# EasyEDA Pro project main_control_board.eprj, board PCB1
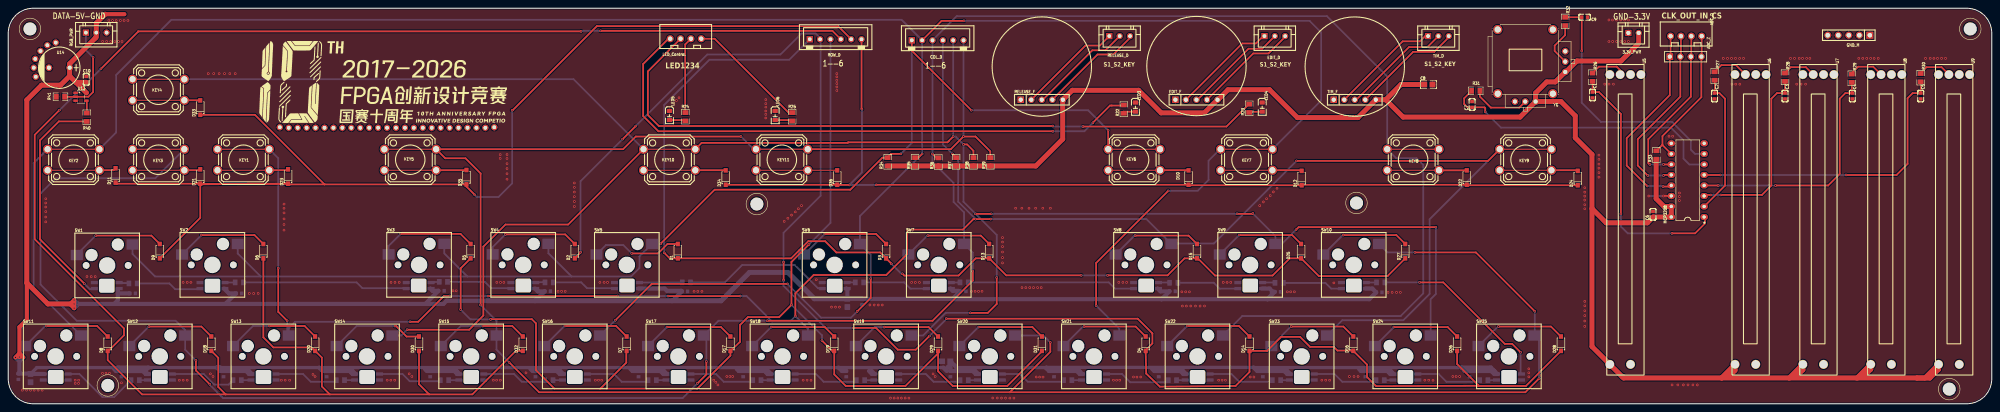
[diagram p1: board, top side]
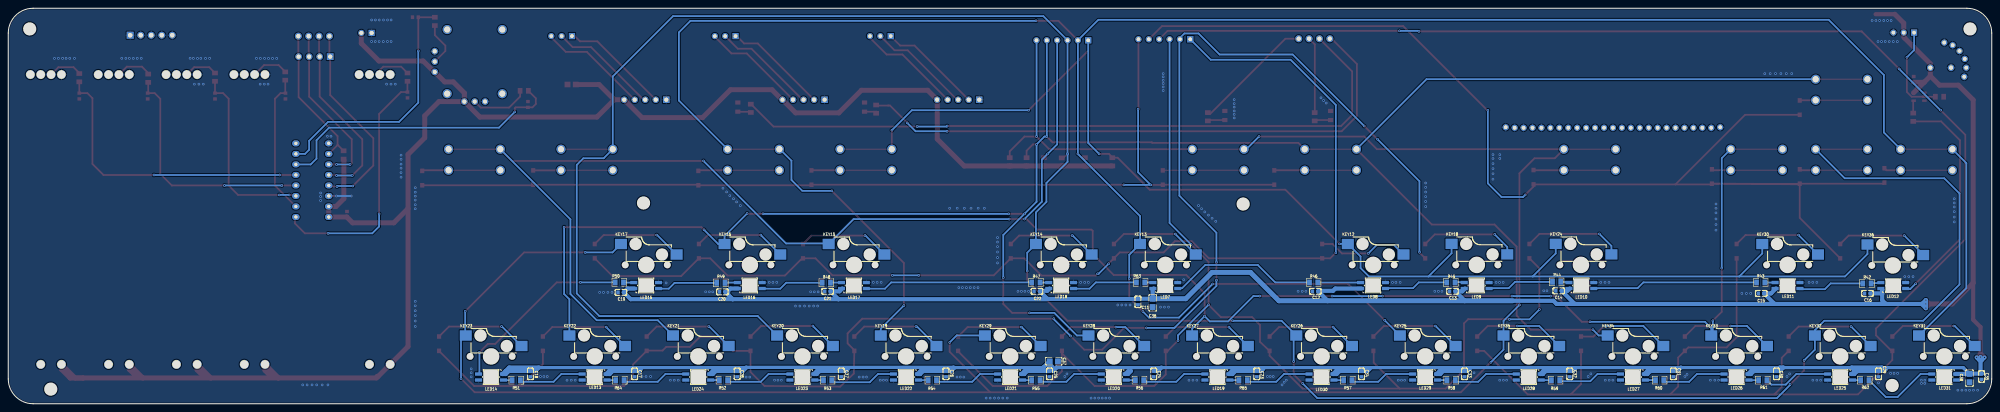
[diagram p2: board, bottom side, seen from below]

Outline 478.92 x 95.5 mm; copper layers: Top Layer, Bottom Layer. Coordinates in mm from the lower left corner of the outline.
Outline path: 0,89.5 0,6 arc(1.76,1.76) 6,0 472.92,0 arc(477.16,1.76) 478.92,6 478.92,89.5 arc(477.16,93.75) 472.92,95.5 6,95.5 arc(1.76,93.75) 0,89.5
Stack: Top Layer 0.035mm / Dielectric1 1.51mm FR4 er 4.5 / Bottom Layer 0.035mm

## Design rules (mm)
template: JLCPCB Capability(Two Layers Board)
spacing copperThickness1oz (default): track to track 0.102, other pairs 0.152 to 0.3
spacing copperThickness2oz: track to track 0.203, other pairs 0.152 to 0.3
track width copperThickness1oz (default): min 0.127, default 0.254, max 2.54
track width copperThickness2oz: min 0.203, default 0.254, max 2.54
differential pair differentialPair (default): width min 0.127, default 0.254, max 2.54; gap min 0.152, default 0.152
via viaSize (default): diameter min 0.5, default 0.61, max 10; hole min 0.3, default 0.305, max 6.3

## Placement (name value [footprint] x y rotation side)
3.3V_PWR  HX-XH2.54-2PZZ  [CONN-TH_2P-P2.50_HX-2.54MM-2P-ZZ-MS]  392.43 89.55 0 top
ADC_D  XH2.54_4P_直插  [CONN-TH_4P-P2.50-XH2.54-4P]  405.13 88.77 180 top
ADC_Z  HDR-M_2.54_1x4P  [HDR-TH_HDR-M_2.54_1X4P]  405 83.82 0 top
C1  100nF  [C0603]  382.52 74.56 270 top
C2  100nF  [C0603]  411.99 74.31 270 top
C3  100nF  [C0603]  429.01 74.31 270 top
C4  100nF  [C0603]  445.26 74.31 270 top
C5  100nF  [C0603]  461.77 74.31 270 top
C6  100nF  [C0603]  397.13 45.73 90 top
C7  100nF  [C0603]  353.44 72.28 90 top
C8  4.7uF  [C0805]  342.9 77.09 0 top
C9  100nF  [C0603]  380.62 93.35 180 top
C10  100nF  [C0603]  18.83 78.33 270 top
C11  100nF  [C0603]  206.15 24.61 90 bottom
C12  100nF  [C0603]  163.32 27.14 180 bottom
C13  100nF  [C0603]  130.21 27.15 0 bottom
C14  100nF  [C0603]  104.55 27.27 0 bottom
C15  100nF  [C0603]  55.66 26.64 0 bottom
C16  100nF  [C0603]  30 26.64 0 bottom
C17  100nF  [C0603]  327.69 7.21 90 bottom
C18  100nF  [C0603]  352.84 7.21 90 bottom
C19  100nF  [C0603]  330.99 26.89 0 bottom
C20  100nF  [C0603]  306.48 27.02 0 bottom
C21  100nF  [C0603]  281.08 27.15 0 bottom
C22  100nF  [C0603]  230.54 27.15 0 bottom
C23  100nF  [C0603]  177.45 7.21 90 bottom
C24  100nF  [C0603]  202.34 7.21 90 bottom
C25  100nF  [C0603]  227.49 7.21 270 bottom
C26  100nF  [C0603]  252.51 7.21 270 bottom
C27  100nF  [C0603]  277.78 7.21 270 bottom
C28  100nF  [C0603]  302.93 7.21 270 bottom
C29  100nF  [C0603]  27.34 7.21 90 bottom
C30  100nF  [C0603]  51.97 7.21 90 bottom
C31  100nF  [C0603]  76.87 7.21 270 bottom
C32  100nF  [C0603]  101.89 7.21 270 bottom
C33  100nF  [C0603]  127.29 7.21 270 bottom
C34  100nF  [C0603]  152.18 7.21 270 bottom
C35  100nF  [C0603]  2.44 6.57 90 bottom
C36  10uF  [C0805]  202.6 24.35 270 bottom
C37  10uF  [C0805]  226.47 10.26 180 bottom
C38  10uF  [C0805]  5.37 6.19 270 bottom
COL_D  HX-XH2.54-6PZZ  [CONN-TH_6P-P2.50_BX-XH2.54-6PZZ]  224.41 87.77 0 top
D1  1N4148W  [SOD-123F_L2.7-W1.6-LS3.8-RD]  161.67 36.84 90 top
D2  1N4148W  [SOD-123F_L2.7-W1.6-LS3.8-RD]  136.78 36.84 90 top
D3  1N4148W  [SOD-123F_L2.7-W1.6-LS3.8-RD]  211.96 36.84 90 top
D4  1N4148W  [SOD-123F_L2.7-W1.6-LS3.8-RD]  274.63 14.49 90 top
D5  1N4148W  [SOD-123F_L2.7-W1.6-LS3.8-RD]  111.63 36.84 90 top
D6  1N4148W  [SOD-123F_L2.7-W1.6-LS3.8-RD]  61.6 36.84 90 top
D7  1N4148W  [SOD-123F_L2.7-W1.6-LS3.8-RD]  149.3 14.49 90 top
D8  1N4148W  [SOD-123F_L2.7-W1.6-LS3.8-RD]  24 14.49 90 top
D9  1N4148W  [SOD-123F_L2.7-W1.6-LS3.8-RD]  36.58 36.84 90 top
D10  1N4148W  [SOD-123F_L2.7-W1.6-LS3.8-RD]  284.99 54.62 90 top
D11  1N4148W  [SOD-123F_L2.7-W1.6-LS3.8-RD]  25.91 55.13 90 top
D12  1N4148W  [SOD-123F_L2.7-W1.6-LS3.8-RD]  312.29 54.5 90 top
D13  1N4148W  [SOD-123F_L2.7-W1.6-LS3.8-RD]  236.86 36.84 90 top
D14  1N4148W  [SOD-123F_L2.7-W1.6-LS3.8-RD]  299.7 14.49 90 top
D15  1N4148W  [SOD-123F_L2.7-W1.6-LS3.8-RD]  287.02 36.84 90 top
D16  1N4148W  [SOD-123F_L2.7-W1.6-LS3.8-RD]  324.77 14.49 90 top
D17  1N4148W  [SOD-123F_L2.7-W1.6-LS3.8-RD]  174.37 14.49 90 top
D18  1N4148W  [SOD-123F_L2.7-W1.6-LS3.8-RD]  49.03 14.49 90 top
D19  1N4148W  [SOD-123F_L2.7-W1.6-LS3.8-RD]  199.43 14.49 90 top
D20  1N4148W  [SOD-123F_L2.7-W1.6-LS3.8-RD]  74.1 14.49 90 top
D21  1N4148W  [SOD-123F_L2.7-W1.6-LS3.8-RD]  46.36 54.88 90 top
D22  1N4148W  [SOD-123F_L2.7-W1.6-LS3.8-RD]  352.17 54.62 90 top
D23  1N4148W  [SOD-123F_L2.7-W1.6-LS3.8-RD]  67.56 54.88 90 top
D24  1N4148W  [SOD-123F_L2.7-W1.6-LS3.8-RD]  378.97 54.5 90 top
D25  1N4148W  [SOD-123F_L2.7-W1.6-LS3.8-RD]  312.17 36.84 90 top
D26  1N4148W  [SOD-123F_L2.7-W1.6-LS3.8-RD]  349.84 14.49 90 top
D27  1N4148W  [SOD-123F_L2.7-W1.6-LS3.8-RD]  337.31 36.84 90 top
D28  1N4148W  [SOD-123F_L2.7-W1.6-LS3.8-RD]  374.9 14.49 90 top
D29  1N4148W  [SOD-123F_L2.7-W1.6-LS3.8-RD]  224.5 14.49 90 top
D30  1N4148W  [SOD-123F_L2.7-W1.6-LS3.8-RD]  99.17 14.49 90 top
D31  1N4148W  [SOD-123F_L2.7-W1.6-LS3.8-RD]  249.57 14.49 90 top
D32  1N4148W  [SOD-123F_L2.7-W1.6-LS3.8-RD]  124.23 14.49 90 top
D33  1N4148W  [SOD-123F_L2.7-W1.6-LS3.8-RD]  46.36 71.51 90 top
D34  1N4148W  [SOD-123F_L2.7-W1.6-LS3.8-RD]  173.23 54.62 90 top
D35  1N4148W  [SOD-123F_L2.7-W1.6-LS3.8-RD]  110.63 54.71 90 top
D36  1N4148W  [SOD-123F_L2.7-W1.6-LS3.8-RD]  200.15 54.62 90 top
EDIT_D  HX 2.54mm-3P ZZ-MS  [CONN-TH_3P-P2.50_HX-2.54MM-3P-ZZ-MS]  305.82 88.79 0 top
EDIT_F  -  [HDR-TH_5P-P2.54-V-F]  286.89 73.42 0 top
GND_M  -  [HDR-TH_5P-P2.54-V-M]  444.4 89 180 top
KEY1  轻触开关12x12x9直插  [KEY-TH_4P-L12.0-W12.0-P5.00-LS12.5]  56.77 58.93 0 top
KEY2  轻触开关12x12x9直插  [KEY-TH_4P-L12.0-W12.0-P5.00-LS12.5]  15.75 58.93 0 top
KEY3  轻触开关12x12x9直插  [KEY-TH_4P-L12.0-W12.0-P5.00-LS12.5]  36.26 58.93 0 top
KEY4  轻触开关12x12x9直插  [KEY-TH_4P-L12.0-W12.0-P5.00-LS12.5]  36.26 75.83 0 top
KEY5  轻触开关12x12x9直插  [KEY-TH_4P-L12.0-W12.0-P5.00-LS12.5]  97.06 58.93 0 top
KEY6  轻触开关12x12x9直插  [KEY-TH_4P-L12.0-W12.0-P5.00-LS12.5]  271.84 58.93 0 top
KEY7  轻触开关12x12x9直插  [KEY-TH_4P-L12.0-W12.0-P5.00-LS12.5]  298.99 58.93 0 top
KEY8  轻触开关12x12x9直插  [KEY-TH_4P-L12.0-W12.0-P5.00-LS12.5]  339.21 58.93 0 top
KEY9  轻触开关12x12x9直插  [KEY-TH_4P-L12.0-W12.0-P5.00-LS12.5]  366.36 58.93 0 top
KEY10  轻触开关12x12x9直插  [KEY-TH_4P-L12.0-W12.0-P5.00-LS12.5]  159.64 58.93 0 top
KEY11  轻触开关12x12x9直插  [KEY-TH_4P-L12.0-W12.0-P5.00-LS12.5]  186.78 58.93 0 top
KEY12  CPG151101S11  [TH_L10.9-W5.9-CPG151101S11]  148.75 37.31 180 bottom
KEY13  CPG151101S11  [TH_L10.9-W5.9-CPG151101S11]  198.91 37.31 180 bottom
KEY14  CPG151101S11  [TH_L10.9-W5.9-CPG151101S11]  224.06 37.31 180 bottom
KEY15  CPG151101S11  [TH_L10.9-W5.9-CPG151101S11]  274.1 37.31 180 bottom
KEY16  CPG151101S11  [TH_L10.9-W5.9-CPG151101S11]  299.24 37.31 180 bottom
KEY17  CPG151101S11  [TH_L10.9-W5.9-CPG151101S11]  324.26 37.31 180 bottom
KEY18  CPG151101S11  [TH_L10.9-W5.9-CPG151101S11]  123.7 37.34 180 bottom
KEY19  CPG151101S11  [TH_L10.9-W5.9-CPG151101S11]  261.52 15.21 180 bottom
KEY20  CPG151101S11  [TH_L10.9-W5.9-CPG151101S11]  286.54 15.21 180 bottom
KEY21  CPG151101S11  [TH_L10.9-W5.9-CPG151101S11]  311.69 15.21 180 bottom
KEY22  CPG151101S11  [TH_L10.9-W5.9-CPG151101S11]  336.71 15.21 180 bottom
KEY23  CPG151101S11  [TH_L10.9-W5.9-CPG151101S11]  361.73 15.21 180 bottom
KEY24  CPG151101S11  [TH_L10.9-W5.9-CPG151101S11]  98.55 37.34 180 bottom
KEY25  CPG151101S11  [TH_L10.9-W5.9-CPG151101S11]  136.18 15.21 180 bottom
KEY26  CPG151101S11  [TH_L10.9-W5.9-CPG151101S11]  161.19 15.21 180 bottom
KEY27  CPG151101S11  [TH_L10.9-W5.9-CPG151101S11]  186.34 15.21 180 bottom
KEY28  CPG151101S11  [TH_L10.9-W5.9-CPG151101S11]  211.36 15.21 180 bottom
KEY29  CPG151101S11  [TH_L10.9-W5.9-CPG151101S11]  236.38 15.21 180 bottom
KEY30  CPG151101S11  [TH_L10.9-W5.9-CPG151101S11]  48.67 37.31 180 bottom
KEY31  CPG151101S11  [TH_L10.9-W5.9-CPG151101S11]  10.83 15.21 180 bottom
KEY32  CPG151101S11  [TH_L10.9-W5.9-CPG151101S11]  35.97 15.21 180 bottom
KEY33  CPG151101S11  [TH_L10.9-W5.9-CPG151101S11]  60.99 15.21 180 bottom
KEY34  CPG151101S11  [TH_L10.9-W5.9-CPG151101S11]  86.01 15.21 180 bottom
KEY35  CPG151101S11  [TH_L10.9-W5.9-CPG151101S11]  111.16 15.21 180 bottom
KEY36  CPG151101S11  [TH_L10.9-W5.9-CPG151101S11]  23.27 37.18 180 bottom
LED3  NCD0805R1  [LED0805-RD]  272.16 71.64 270 top
LED4  NCD0805R1  [LED0805-RD]  302.77 71.64 270 top
LED5  NCD0805R1  [LED0805-RD]  159.64 69.61 270 top
LED6  NCD0805R1  [LED0805-RD]  185.17 69.61 270 top
LED7  SK6812MINI-E  [LED-SMD_4P-L3.2-W2.8-LS5.9_SK6812MINI-E]  199.55 28.54 180 bottom
LED8  SK6812MINI-E  [LED-SMD_4P-L3.2-W2.8-LS5.9_SK6812MINI-E]  149.38 28.54 180 bottom
LED9  SK6812MINI-E  [LED-SMD_4P-L3.2-W2.8-LS5.9_SK6812MINI-E]  124.36 28.54 180 bottom
LED10  SK6812MINI-E  [LED-SMD_4P-L3.2-W2.8-LS5.9_SK6812MINI-E]  99.09 28.54 180 bottom
LED11  SK6812MINI-E  [LED-SMD_4P-L3.2-W2.8-LS5.9_SK6812MINI-E]  49.31 28.54 180 bottom
LED12  SK6812MINI-E  [LED-SMD_4P-L3.2-W2.8-LS5.9_SK6812MINI-E]  23.78 28.54 180 bottom
LED13  SK6812MINI-E  [LED-SMD_4P-L3.2-W2.8-LS5.9_SK6812MINI-E]  337.34 6.45 0 bottom
LED14  SK6812MINI-E  [LED-SMD_4P-L3.2-W2.8-LS5.9_SK6812MINI-E]  362.36 6.45 0 bottom
LED15  SK6812MINI-E  [LED-SMD_4P-L3.2-W2.8-LS5.9_SK6812MINI-E]  324.9 28.54 180 bottom
LED16  SK6812MINI-E  [LED-SMD_4P-L3.2-W2.8-LS5.9_SK6812MINI-E]  299.88 28.54 180 bottom
LED17  SK6812MINI-E  [LED-SMD_4P-L3.2-W2.8-LS5.9_SK6812MINI-E]  274.73 28.54 180 bottom
LED18  SK6812MINI-E  [LED-SMD_4P-L3.2-W2.8-LS5.9_SK6812MINI-E]  224.69 28.54 180 bottom
LED19  SK6812MINI-E  [LED-SMD_4P-L3.2-W2.8-LS5.9_SK6812MINI-E]  186.98 6.45 0 bottom
LED20  SK6812MINI-E  [LED-SMD_4P-L3.2-W2.8-LS5.9_SK6812MINI-E]  211.99 6.45 0 bottom
LED21  SK6812MINI-E  [LED-SMD_4P-L3.2-W2.8-LS5.9_SK6812MINI-E]  237.01 6.45 0 bottom
LED22  SK6812MINI-E  [LED-SMD_4P-L3.2-W2.8-LS5.9_SK6812MINI-E]  262.16 6.45 0 bottom
LED23  SK6812MINI-E  [LED-SMD_4P-L3.2-W2.8-LS5.9_SK6812MINI-E]  287.18 6.45 0 bottom
LED24  SK6812MINI-E  [LED-SMD_4P-L3.2-W2.8-LS5.9_SK6812MINI-E]  312.32 6.45 0 bottom
LED25  SK6812MINI-E  [LED-SMD_4P-L3.2-W2.8-LS5.9_SK6812MINI-E]  36.61 6.45 0 bottom
LED26  SK6812MINI-E  [LED-SMD_4P-L3.2-W2.8-LS5.9_SK6812MINI-E]  61.63 6.45 0 bottom
LED27  SK6812MINI-E  [LED-SMD_4P-L3.2-W2.8-LS5.9_SK6812MINI-E]  86.65 6.45 0 bottom
LED28  SK6812MINI-E  [LED-SMD_4P-L3.2-W2.8-LS5.9_SK6812MINI-E]  111.79 6.45 0 bottom
LED29  SK6812MINI-E  [LED-SMD_4P-L3.2-W2.8-LS5.9_SK6812MINI-E]  136.81 6.45 0 bottom
LED30  SK6812MINI-E  [LED-SMD_4P-L3.2-W2.8-LS5.9_SK6812MINI-E]  161.83 6.45 0 bottom
LED31  SK6812MINI-E  [LED-SMD_4P-L3.2-W2.8-LS5.9_SK6812MINI-E]  11.46 6.45 0 bottom
LED_Control  XH2.54_4P_直插  [CONN-TH_4P-P2.50-XH2.54-4P]  163.58 88.15 180 top
MCP3208  MCP3208-BI/P  [PDIP-16_L19.3-W6.4-P2.54-LS7.94-BL]  405.51 53.99 90 top
NOREF  -  [Pad_e3146]  97.93 66.64 0 top
NOREF#2  -  [Pad_e3066]  6.51 83.28 0 top
NOREF#3  -  [Pad_e3147]  95.77 66.64 0 top
NOREF#4  -  [Pad_e3154]  80.67 66.64 0 top
NOREF#5  -  [Pad_e3155]  78.51 66.64 0 top
NOREF#6  -  [Pad_e3148]  93.61 66.64 0 top
NOREF#7  -  [Pad_e3143]  104.4 66.64 0 top
NOREF#8  -  [Pad_e3151]  87.14 66.64 0 top
NOREF#9  -  [Pad_e3153]  82.83 66.64 0 top
NOREF#10  -  [Pad_e3072]  11.46 87.22 0 top
NOREF#11  -  [Pad_e3160]  67.72 66.64 0 top
NOREF#12  -  [Pad_e3159]  69.88 66.64 0 top
NOREF#13  -  [Pad_e3138]  115.19 66.64 0 top
NOREF#14  -  [Pad_e3140]  110.88 66.64 0 top
NOREF#15  -  [Pad_e3150]  89.3 66.64 0 top
NOREF#16  -  [Pad_e3142]  106.56 66.64 0 top
NOREF#17  -  [Pad_e3071]  9.43 86.58 0 top
NOREF#18  -  [Pad_e3145]  100.09 66.64 0 top
NOREF#19  -  [Pad_e3152]  84.98 66.64 0 top
NOREF#20  -  [Pad_e3144]  102.25 66.64 0 top
NOREF#21  -  [Pad_e3158]  72.04 66.64 0 top
NOREF#22  -  [Pad_e3067]  7.78 85.19 0 top
NOREF#23  -  [Pad_e3068]  6.64 78.96 0 top
NOREF#24  -  [Pad_e3139]  113.04 66.64 0 top
NOREF#25  -  [Pad_e3149]  91.46 66.64 0 top
NOREF#26  -  [Pad_e3161]  65.56 66.77 0 top
NOREF#27  -  [Pad_e3137]  117.35 66.77 0 top
NOREF#28  -  [Pad_e3141]  108.72 66.64 0 top
NOREF#29  -  [Pad_e3156]  76.35 66.64 0 top
NOREF#30  -  [Pad_e3157]  74.19 66.64 0 top
NOREF#31  -  [Pad_e3065]  6.16 81.15 0 top
R22  1kΩ  [R0805]  269.38 71.15 90 top
R23  1kΩ  [R0805]  299.62 71.34 90 top
R24  1kΩ  [R0805]  163.48 69.31 90 top
R25  1kΩ  [R0805]  189.26 69.31 90 top
R26  1kΩ  [R0805]  382.52 78.87 270 top
R27  1kΩ  [R0805]  412.05 79.15 270 top
R28  1kΩ  [R0805]  429.01 78.87 270 top
R29  1kΩ  [R0805]  445.14 78.61 270 top
R30  1kΩ  [R0805]  461.77 78.74 270 top
R31  1kΩ  [R0805]  354.33 75.57 180 top
R32  1kΩ  [R0805]  375.92 92.33 270 top
R33  10kΩ  [R0805]  397.94 60.08 90 top
R34  1kΩ  [R0805]  212.34 58.42 90 top
R35  1kΩ  [R0805]  218.95 58.42 90 top
R36  1kΩ  [R0805]  224.57 58.36 90 top
R37  1kΩ  [R0805]  228.85 58.42 90 top
R38  1kΩ  [R0805]  233.05 58.42 90 top
R39  1kΩ  [R0805]  237.11 58.42 90 top
R40  330Ω  [R0805]  18.95 69.18 270 top
R41  10kΩ  [R0805]  12.6 74.14 0 top
R42  330Ω  [R0805]  30.13 29.05 180 bottom
R43  330Ω  [R0805]  55.78 29.31 180 bottom
R44  330Ω  [R0805]  105.06 29.43 180 bottom
R45  330Ω  [R0805]  130.59 29.31 180 bottom
R46  330Ω  [R0805]  163.73 29.31 180 bottom
R47  330Ω  [R0805]  230.79 29.31 180 bottom
R48  330Ω  [R0805]  281.4 29.22 180 bottom
R49  330Ω  [R0805]  306.86 29.18 180 bottom
R50  330Ω  [R0805]  331.37 29.31 180 bottom
R51  330Ω  [R0805]  356.27 5.68 0 bottom
R52  330Ω  [R0805]  306.23 5.68 0 bottom
R53  330Ω  [R0805]  281.08 5.68 0 bottom
R54  330Ω  [R0805]  255.81 5.68 0 bottom
R55  330Ω  [R0805]  230.79 5.68 0 bottom
R56  330Ω  [R0805]  205.77 5.68 0 bottom
R57  330Ω  [R0805]  155.48 5.68 0 bottom
R58  330Ω  [R0805]  130.53 5.69 0 bottom
R59  330Ω  [R0805]  105.31 5.68 0 bottom
R60  330Ω  [R0805]  80.18 5.69 0 bottom
R61  330Ω  [R0805]  55.28 5.68 0 bottom
R62  330Ω  [R0805]  30.64 5.68 0 bottom
R63  330Ω  [R0805]  205.52 29.31 180 bottom
R64  330Ω  [R0805]  331.25 5.68 0 bottom
R65  330Ω  [R0805]  180.75 5.68 0 bottom
RELEASE_D  HX 2.54mm-3P ZZ-MS  [CONN-TH_3P-P2.50_HX-2.54MM-3P-ZZ-MS]  268.35 88.79 0 top
RELEASE_F  -  [HDR-TH_5P-P2.54-V-F]  249.56 73.42 0 top
RGB_PWR  HX 2.54mm-3P ZZ-MS  [CONN-TH_3P-P2.50_HX-2.54MM-3P-ZZ-MS]  21.24 89.63 0 top
ROW_D  HX-XH2.54-6PZZ  [CONN-TH_6P-P2.50_BX-XH2.54-6PZZ]  199.77 88.02 0 top
SW1  MX1A-11NW  [SW-TH_MX1A-11NW]  23.24 37.21 0 top
SW2  MX1A-11NW  [SW-TH_MX1A-11NW]  48.64 37.34 0 top
SW3  MX1A-11NW  [SW-TH_MX1A-11NW]  98.55 37.34 0 top
SW4  MX1A-11NW  [SW-TH_MX1A-11NW]  123.7 37.34 0 top
SW5  MX1A-11NW  [SW-TH_MX1A-11NW]  148.72 37.34 0 top
SW6  MX1A-11NW  [SW-TH_MX1A-11NW]  198.88 37.34 0 top
SW7  MX1A-11NW  [SW-TH_MX1A-11NW]  224.03 37.34 0 top
SW8  MX1A-11NW  [SW-TH_MX1A-11NW]  274.07 37.34 0 top
SW9  MX1A-11NW  [SW-TH_MX1A-11NW]  299.21 37.34 0 top
SW10  MX1A-11NW  [SW-TH_MX1A-11NW]  324.23 37.34 0 top
SW11  MX1A-11NW  [SW-TH_MX1A-11NW]  10.8 15.24 0 top
SW12  MX1A-11NW  [SW-TH_MX1A-11NW]  35.94 15.24 0 top
SW13  MX1A-11NW  [SW-TH_MX1A-11NW]  60.96 15.24 0 top
SW14  MX1A-11NW  [SW-TH_MX1A-11NW]  85.98 15.24 0 top
SW15  MX1A-11NW  [SW-TH_MX1A-11NW]  111.12 15.24 0 top
SW16  MX1A-11NW  [SW-TH_MX1A-11NW]  136.14 15.24 0 top
SW17  MX1A-11NW  [SW-TH_MX1A-11NW]  161.16 15.24 0 top
SW18  MX1A-11NW  [SW-TH_MX1A-11NW]  186.31 15.24 0 top
SW19  MX1A-11NW  [SW-TH_MX1A-11NW]  211.33 15.24 0 top
SW20  MX1A-11NW  [SW-TH_MX1A-11NW]  236.35 15.24 0 top
SW21  MX1A-11NW  [SW-TH_MX1A-11NW]  261.49 15.24 0 top
SW22  MX1A-11NW  [SW-TH_MX1A-11NW]  286.51 15.24 0 top
SW23  MX1A-11NW  [SW-TH_MX1A-11NW]  311.66 15.24 0 top
SW24  MX1A-11NW  [SW-TH_MX1A-11NW]  336.68 15.24 0 top
SW25  MX1A-11NW  [SW-TH_MX1A-11NW]  361.7 15.24 0 top
TIM_D  HX 2.54mm-3P ZZ-MS  [CONN-TH_3P-P2.50_HX-2.54MM-3P-ZZ-MS]  345.31 88.79 0 top
TIM_F  -  [HDR-TH_5P-P2.54-V-F]  325.12 73.42 0 top
U1  M3x10+6Cu  [SMD_L4.7-W4.7-D3.0]  5.24 90.52 0 top
U2  M3x10+6Cu  [SMD_L4.7-W4.7-D3.0]  473.74 90.52 0 top
U3  M3x10+6Cu  [SMD_L4.7-W4.7-D3.0]  24.03 4.41 0 top
U4  M3x10+6Cu  [SMD_L4.7-W4.7-D3.0]  468.66 3.52 0 top
U5  -  [Potentiometer]  394.21 79.5 270 top
U6  -  [Potentiometer]  424.43 79.5 270 top
U7  -  [Potentiometer]  440.82 79.5 270 top
U8  -  [Potentiometer]  457.2 79.5 270 top
U9  -  [Potentiometer]  473.58 79.5 270 top
U10  M3x10+6Cu  [SMD_L4.7-W4.7-D3.0]  180.75 48.23 0 top
U11  M3x10+6Cu  [SMD_L4.7-W4.7-D3.0]  325.53 48.48 0 top
U13  SN74AHCT1G125DBVR  [SOT-23-5_L3.0-W1.7-P0.95-LS2.8-BR]  17.56 74.14 180 top
U14  220uF  [CAP-TH_BD10.0-P5.00-D0.6-FD]  12.32 81.15 180 top
YG  YF16-FL7.2-B5Ka(45-10)-R-A28  [JOYTICK-TH_YF16-DFL7.2-B5KO-45-10-B5KO-55--RG-A22]  367.79 81.67 0 top

## Footprints (pads in the part's own frame, mm; a bottom-side part is the same pattern mirrored in y, then rotated)
C0603
  rect 0.8x0.9 smd: 1(-0.7,0) 2(0.7,0)
C0805
  rect 1.41x1.35 smd: 1(-1,0) 2(1,0)
CAP-TH_BD10.0-P5.00-D0.6-FD
  round 1.6 hole 1: 1(-2.5,0) 2(2.5,0)
CONN-TH_2P-P2.50_HX-2.54MM-2P-ZZ-MS
  rect 1.5x1.5 hole 1: 1(-1.25,0)
  round 1.5 hole 1: 2(1.25,0)
CONN-TH_3P-P2.50_HX-2.54MM-3P-ZZ-MS
  rect 1.5x1.5 hole 0.9: 1(-2.5,0)
  round 1.5 hole 0.9: 2(0,0) 3(2.5,0)
CONN-TH_4P-P2.50-XH2.54-4P
  round 1.7 hole 1.05: 1(3.75,0) 2(1.25,0) 3(-1.25,0) 4(-3.75,0)
CONN-TH_6P-P2.50_BX-XH2.54-6PZZ
  rect 1.524x1.524 hole 0.914: 1(-6.25,0)
  round 1.524 hole 0.914: 2(-3.75,0) 3(-1.25,0) 4(1.25,0) 5(3.75,0) 6(6.25,0)
HDR-TH_5P-P2.54-V-F
  rect 1.575x1.575 hole 1.02: 1(-5.08,0)
  round 1.575 hole 1.02: 2(-2.54,0) 3(0,0) 4(2.54,0) 5(5.08,0)
HDR-TH_5P-P2.54-V-M
  rect 1.7x1.7 hole 1.1: 1(-5.08,0)
  round 1.7 hole 1.1: 2(-2.54,0) 3(0,0) 4(2.54,0) 5(5.08,0)
HDR-TH_HDR-M_2.54_1X4P
  rect 1.62x1.62 hole 1.02: 1(-3.81,0)
  round 1.62 hole 1.02: 2(-1.27,0) 3(1.27,0) 4(3.81,0)
JOYTICK-TH_YF16-DFL7.2-B5KO-45-10-B5KO-55--RG-A22
  round 1.6 hole 1: 1(-4,-8.7) 2(-1.5,-8.7) 3(1,-8.7) 4(8.15,3.45) 5(8.15,0.95) 6(8.15,-1.55)
  round 2.2 hole 1.5: 7(-8.15,8.7) 8(5.15,8.7) 9(5.15,-6.8) 10(-8.15,-6.8)
KEY-TH_4P-L12.0-W12.0-P5.00-LS12.5
  round 2.2 hole 1.5: 1(-6.251,2.54) 2(6.251,2.54) 3(-6.251,-2.54) 4(6.251,-2.54)
LED0805-RD
  rect 1x1.25 smd: 1(-1.1,0) 2(1.1,0)
LED-SMD_4P-L3.2-W2.8-LS5.9_SK6812MINI-E
  rect 1.7x0.8 smd: 1(-3,-0.725) 2(-3,0.725) 3(3,0.725) 4(3,-0.725)
Pad_e3065
  round 1.524 hole 0.914: 1(0,0)
Pad_e3066
  round 1.524 hole 0.914: 2(0,0)
Pad_e3067
  round 1.524 hole 0.914: 3(0,0)
Pad_e3068
  round 1.524 hole 0.914: 4(0,0)
Pad_e3071
  round 1.524 hole 0.914: 1(0,0)
Pad_e3072
  round 1.524 hole 0.914: 2(0,0)
Pad_e3137
  round 1.524 hole 0.914: 3(0,0)
Pad_e3138
  round 1.524 hole 0.914: 4(0,0)
Pad_e3139
  round 1.524 hole 0.914: 5(0,0)
Pad_e3140
  round 1.524 hole 0.914: 6(0,0)
Pad_e3141
  round 1.524 hole 0.914: 7(0,0)
Pad_e3142
  round 1.524 hole 0.914: 8(0,0)
Pad_e3143
  round 1.524 hole 0.914: 9(0,0)
Pad_e3144
  round 1.524 hole 0.914: 10(0,0)
Pad_e3145
  round 1.524 hole 0.914: 11(0,0)
Pad_e3146
  round 1.524 hole 0.914: 12(0,0)
Pad_e3147
  round 1.524 hole 0.914: 13(0,0)
Pad_e3148
  round 1.524 hole 0.914: 14(0,0)
Pad_e3149
  round 1.524 hole 0.914: 15(0,0)
Pad_e3150
  round 1.524 hole 0.914: 16(0,0)
Pad_e3151
  round 1.524 hole 0.914: 17(0,0)
Pad_e3152
  round 1.524 hole 0.914: 18(0,0)
Pad_e3153
  round 1.524 hole 0.914: 19(0,0)
Pad_e3154
  round 1.524 hole 0.914: 20(0,0)
Pad_e3155
  round 1.524 hole 0.914: 21(0,0)
Pad_e3156
  round 1.524 hole 0.914: 22(0,0)
Pad_e3157
  round 1.524 hole 0.914: 23(0,0)
Pad_e3158
  round 1.524 hole 0.914: 24(0,0)
Pad_e3159
  round 1.524 hole 0.914: 25(0,0)
Pad_e3160
  round 1.524 hole 0.914: 26(0,0)
Pad_e3161
  round 1.524 hole 0.914: 27(0,0)
PDIP-16_L19.3-W6.4-P2.54-LS7.94-BL
  oval 1.44x1.8 hole 0.8: 1(-8.89,-3.97) 2(-6.35,-3.97) 3(-3.81,-3.97) 4(-1.27,-3.97) 5(1.27,-3.97) 6(3.81,-3.97) 7(6.35,-3.97) 8(8.89,-3.97) 9(8.89,3.97) 10(6.35,3.97) 11(3.81,3.97) 12(1.27,3.97) 13(-1.27,3.97) 14(-3.81,3.97) 15(-6.35,3.97) 16(-8.89,3.97)
Potentiometer
  round 2.2 hole 2x1.2: 1(70,-7.5) 2(70,-2.5) 3(0,-7.5) 4(0,-5) 5(0,-2.5) 6(0,0)
R0805
  rect 1.133x1.377 smd: 1(-1,0) 2(1,0)
SOD-123F_L2.7-W1.6-LS3.8-RD
  rect 1.1x1 smd: 1(-1.735,0) 2(1.735,0)
SOT-23-5_L3.0-W1.7-P0.95-LS2.8-BR
  rect 1.1x0.6 smd: 1(1.3,-0.95) 2(1.3,0) 3(1.3,0.95) 4(-1.3,0.95) 5(-1.3,-0.95)
TH_L10.9-W5.9-CPG151101S11
  rect 2.9x2.5 smd: 1(-6.725,1.27) 2(6.725,-1.27)

## Nets
As in the schematic, except:
GND: 3.3V_PWR.1 C1.2 C2.2 C3.2 C4.2 C5.2 C6.2 C7.2 C8.2 C9.1 C10.1 C11.1 C12.1 C13.2 C14.2 C15.2 C16.2 C17.1 C18.1 C19.2 C20.2 C21.2 C22.2 C23.1 C24.1 C25.2 C26.2 C27.2 C28.2 C29.1 C30.1 C31.2 C32.2 C33.2 C34.2 C35.1 C36.2 C37.2 C38.2 EDIT_F.1 GND_M.1 GND_M.2 GND_M.3 GND_M.4 GND_M.5 LED3.1 LED4.1 LED5.1 LED6.1 LED7.3 LED8.3 LED9.3 LED10.3 LED11.3 LED12.3 LED13.3 LED14.3 LED15.3 LED16.3 LED17.3 LED18.3 LED19.3 LED20.3 LED21.3 LED22.3 LED23.3 LED24.3 LED25.3 LED26.3 LED27.3 LED28.3 LED29.3 LED30.3 LED31.3 MCP3208.9 MCP3208.14 NOREF.12 NOREF#2.2 NOREF#3.13 NOREF#4.20 NOREF#5.21 NOREF#6.14 NOREF#7.9 NOREF#8.17 NOREF#9.19 NOREF#10.2 NOREF#11.26 NOREF#12.25 NOREF#13.4 NOREF#14.6 NOREF#15.16 NOREF#16.8 NOREF#17.1 NOREF#18.11 NOREF#19.18 NOREF#20.10 NOREF#21.24 NOREF#22.3 NOREF#23.4 NOREF#24.5 NOREF#25.15 NOREF#26.27 NOREF#27.3 NOREF#28.7 NOREF#29.22 NOREF#30.23 NOREF#31.1 R41.1 RELEASE_F.1 RGB_PWR.3 TIM_F.1 U5.3 U6.3 U7.3 U8.3 U9.3 U13.1 U13.3 U14.2 YG.1 YG.4

Pads without a net: LED31 2; MCP3208 8; U5 2 5 6; U6 2 5 6; U7 2 5 6; U8 2 5 6; U9 2 5 6; YG 7 8 9 10

## Via types
v1: diameter 0.61, hole 0.305, Top Layer to Bottom Layer, 450 vias

## Routing (per net, layer and track width the routed paths; a pad name or vN(x,y) marks a point on that pad's centre or on a via; arc(x,y) is an arc through that point)
3.3V: length 453.5
  Top Layer w1.2: 431.58,6.45 433.32,8.19 U7.1 430.04,6.22 ; 382.4,47.12 385.83,43.69 395.78,43.69 397.19,45.1 MCP3208.16 MCP3208.15 399.78,47.64 397.89,49.53 397.89,58.82 ; 382.4,47.12 382.4,13.81 U5.1 389.61,6.6 389.89,6.6 ; 382.4,47.12 382.4,60.2 378.36,64.23 378.36,69.53 374.92,72.97 YG.3 ; R34.1 R35.1 224.5,57.42 R36.1 224.63,57.42 R37.1 R38.1 R39.1 248.11,57.42 254.6,63.91 254.6,73.39 RELEASE_F.5 256.92,75.71 272.92,75.71 278.38,70.24 288.8,70.24 EDIT_F.5 292.1,73.42 294.51,75.83 304.55,75.83 311.28,69.1 325.88,69.1 TIM_F.5 332.6,73.42 ; 3.3V_PWR.2 393.68,87.04 389.41,82.77 378.75,82.77 376.1,80.12 YG.6 373.54,77.72 371.48,77.72 368.79,75.04 YG.3 ; 415.32,6.45 416.93,8.06 U6.1 413.71,6.28 413.71,6.22 ; 447.96,6.57 449.7,8.31 U8.1 446.42,6.22 ; 332.6,73.42 336.27,77.09 C8.1 ; 332.6,73.42 336.79,69.23 365.05,69.23 YG.3 ; 430.04,6.22 446.42,6.22 ; 430.04,6.22 413.71,6.22 ; 446.42,6.22 460.87,6.22 ; 413.71,6.22 390.02,6.22 389.89,6.35 ; 460.87,6.22 462.8,6.22 U9.1 466.08,8.31 463.96,6.19 460.9,6.19 460.87,6.22
5V: length 1038.4
  Top Layer w1: v1(1.74,11.18) 2.57,12.01 2.7,12.01 ; 2.7,12.01 2.7,18.51 4.48,20.29 4.48,29.18 ; 2.7,12.01 2.8,12.01 v1(3.63,11.18) ; 2.7,12.01 v1(2.7,11.27) ; 15.91,23.72 v1(15.91,23.08) 14.89,24.1 ; 21.24,88.53 21.11,88.4 ; 23.4,94.08 28.03,94.08 ; 14.99,24.1 v1(15.91,24.1) v1(15.91,25.02) 14.99,24.1
  Top Layer w1.2: 16.32,77.63 U13.5 ; 16.32,77.63 14.82,79.13 ; 16.32,77.63 C10.2 ; 21.11,88.4 14.82,82.11 U14.1 14.82,79.15 12.6,76.93 8.03,76.93 4.48,73.37 4.48,29.18 9.56,24.1 14.89,24.1 ; 23.4,94.08 21.24,91.92 RGB_PWR.2 21.24,88.53
  Bottom Layer w0.8: C38.1 6.91,8.73 26.51,8.73 ; 300.69,8.78 250.7,8.78 250.65,8.73 229,8.73 ; 33.81,8.73 50.34,8.73 ; 225.78,8.73 51.15,8.73 ; 300.73,8.73 350.82,8.73
  Bottom Layer w1: 227.49,10.24 C37.1 227.47,9.53 226.68,8.73 ; 227.49,10.24 227.49,7.91 232.87,7.91 ; 227.49,10.24 229.01,8.72 229.01,8.1 ; 32.83,7.91 32.99,7.91 33.81,8.73 26.51,8.73 27.34,7.91 ; 32.83,7.91 32.81,7.88 32.49,7.88 ; 32.83,7.91 32.75,7.97 32.41,7.97 ; 32.83,7.91 33.81,7.17 33.2,7.17 32.49,7.88 ; 82.4,7.91 75.89,7.91 75.06,8.73 ; 82.4,7.91 83.11,7.91 83.85,7.17 83.14,7.17 82.4,7.91 ; 52.11,27.82 53.29,26.64 C15.1 52.42,24.1 ; 32.49,7.88 27.36,7.88 27.34,7.91 ; 32.49,7.88 32.41,7.97 ; 300.73,8.73 301.56,7.91 308.79,7.91 309.52,7.17 308.81,7.17 308.26,7.72 ; 229.39,27.27 228.04,27.27 227.49,27.82 ; 51.97,7.91 51.16,7.91 50.34,8.73 51.15,8.73 51.97,7.91 ; 51.97,7.91 57.43,7.91 ; 175.93,8.35 176.37,7.91 183.44,7.91 184.18,7.17 183.33,7.17 182.91,7.59 ; C22.1 228,25.31 C11.2 206.11,25.35 C36.1 202.6,27.57 202.35,27.82 ; v1(15.91,24.1) v1(15.91,25.02) 16.83,24.1 ; v1(15.91,24.1) 16.83,24.1 ; v1(15.91,24.1) v1(15.91,23.08) 16.83,24 16.83,24.1 ; 157.45,7.91 150.72,7.91 150.15,8.48 ; 157.45,7.91 157.13,8.22 ; 157.45,7.91 158.18,7.17 159.03,7.17 158.29,7.91 157.45,7.91 ; 127.16,27.82 127.84,27.15 C13.1 127.22,24.86 ; 2.7,10.47 2.7,7.53 C35.2 5.28,7.27 C38.1 8.64,7.19 8.66,7.17 ; 2.7,10.47 v1(2.7,11.27) ; 2.7,10.47 2.92,10.47 v1(3.63,11.18) ; 2.7,10.47 2.45,10.47 v1(1.74,11.18) ; 107.68,7.91 108.25,7.91 108.99,7.17 108.41,7.17 107.68,7.91 ; 107.68,7.91 101.06,7.91 100.62,8.35 ; 358.83,7.91 359.56,7.17 358.79,7.17 358.06,7.91 ; 358.83,7.91 358.06,7.91 ; 358.83,7.91 358,8.73 350.82,8.73 351.64,7.91 358.06,7.91 ; 327.7,27.82 329.37,27.82 C19.1 328.64,25.24 304,25.24 ; 232.87,7.91 233.6,7.17 234.21,7.17 233.48,7.91 232.87,7.91 ; 305.34,27.02 304.54,27.82 302.68,27.82 ; 305.34,27.02 C20.1 304,25.24 ; 305.34,27.02 305.09,26.77 ; 250.65,8.73 250.65,8.56 251.3,7.91 258.01,7.91 ; 200.48,8.73 201.3,7.91 202.34,7.91 ; 27.34,7.91 32.41,7.97 ; 27.34,7.91 26,7.91 25.56,8.35 ; 326.17,8.35 326.61,7.91 333.81,7.91 334.54,7.17 333.7,7.17 333.28,7.59 ; 101.89,27.82 102.44,27.27 C14.1 100.68,24.1 ; 304,25.24 278.48,25.24 ; 278.48,25.24 C21.1 278.2,27.15 277.53,27.82 ; 278.48,25.24 228.25,25.24 ; 16.83,24.1 25.56,24.1 ; 26.45,26.55 26.45,24.99 25.56,24.1 ; 26.45,26.55 26.45,27.56 26.58,27.69 ; 26.45,26.55 26.54,26.64 C16.1 ; 283.01,7.91 283.75,7.17 284.38,7.17 283.64,7.91 283.01,7.91 ; 283.01,7.91 276.7,7.91 276.13,8.48 ; 126.02,8.48 126.59,7.91 133.27,7.91 134.01,7.17 133.16,7.17 132.75,7.59 ; 152.18,27.82 158.49,27.82 159.04,27.27 162.49,27.27 C12.2 160.34,24.86 ; 258.01,7.91 258.62,7.91 259.36,7.17 258.75,7.17 258.01,7.91 ; 100.68,24.1 52.42,24.1 ; 100.68,24.1 105.06,24.1 105.82,24.86 115.69,24.86 ; 57.43,7.91 58.17,7.17 58.83,7.17 58.09,7.91 57.43,7.91 ; 208.46,7.91 209.19,7.17 ; 52.42,24.1 25.56,24.1 ; 208.56,7.17 207.82,7.91 ; 225.78,8.73 226.6,7.91
  Bottom Layer w1.2: 115.69,24.86 172.12,24.86 178.97,31.72 188.25,31.72 194.61,25.35 C36.1
GND: length 5.4
  Top Layer w0.42: v1(399.67,50.17) 399.68,50.18 MCP3208.14
  Bottom Layer w0.42: v1(399.67,50.17) v1(396.11,50.17)
  vias: v1(3.4,3.27) v1(4.4,3.27) v1(5.37,3.26) v1(6.25,3.27) v1(7.2,3.27) v1(8.17,3.27) v1(9.05,49.5) v1(9.05,48.49) v1(9.05,47.52) v1(9.05,46.4) v1(9.05,45.08) v1(9.05,43.91) v1(16.16,5.68) v1(16.16,4.92) v1(16.99,5.68) v1(16.96,4.92) v1(19,30.7) v1(20.02,30.7) v1(20.99,30.7) v1(22.79,87.47) v1(22.73,7.33) v1(23.58,7.33) v1(23.77,87.47) v1(24.29,92.55) v1(24.42,7.33) v1(24.74,87.47) v1(25.17,92.55) v1(25.71,87.47) v1(26.06,92.55) v1(26.61,87.47) v1(27.06,92.55) v1(27.34,5.05) v1(27.46,87.47) v1(27.96,92.55) v1(28.89,92.55) v1(41.31,5.68) v1(42.22,29.31) v1(42.24,5.68) v1(43.21,29.31) v1(43.19,5.68) v1(44.1,29.31) v1(48.29,79.72) v1(48.81,7.21) v1(49.43,6.57) v1(49.59,79.72) v1(50.9,79.72) v1(52.22,79.72) v1(53.49,79.72) v1(54.8,79.72) v1(58.2,26.64) v1(59.24,26.64) v1(60.34,26.64) v1(65.94,5.68) v1(66.58,48.23) v1(66.58,47.21) v1(66.58,46.08) v1(66.58,44.62) v1(66.58,43.27) v1(66.58,41.92) v1(66.85,5.68) v1(67.93,5.68) v1(73.56,7.08) v1(74.07,6.57) v1(91.47,5.68) v1(92.42,29.31) v1(92.36,5.68) v1(93.31,5.68) v1(93.37,29.31) v1(94.39,29.31) v1(96.81,7.21) v1(97.44,6.57) v1(107.4,27.27) v1(108.17,27.27) v1(117.13,5.68) v1(117.91,5.68) v1(117.97,29.31) v1(118.78,60.17) v1(118.78,59.24) v1(118.8,5.68) v1(118.87,29.31) v1(119.67,29.31) v1(120.43,60.17) v1(120.43,59.22) v1(120.43,57.98) v1(120.43,56.78) v1(120.43,55.55) v1(120.43,54.24) v1(125,7.46) v1(132.75,27.15) v1(133.6,27.15) v1(134.47,27.15) v1(136.68,53.31) v1(136.68,52.25) v1(136.68,51.13) v1(136.68,50.01) v1(136.68,48.84) v1(136.68,47.61) v1(141.76,5.68) v1(142.51,5.68) v1(142.84,29.31) v1(143.29,5.68) v1(143.86,29.31) v1(144.68,29.31) v1(160.69,72.61) v1(161.32,73.25) v1(161.96,73.88) v1(165.59,27.14) v1(166.49,27.14) v1(167.49,27.14) v1(170.34,5.68) v1(170.85,5.18) v1(171.35,4.54) v1(173.49,6.57) v1(174.22,6.57) v1(174.91,6.57) v1(182.91,73.44) v1(182.91,72.49) v1(182.91,71.64) v1(182.91,70.71) v1(182.91,69.88) v1(182.91,69.02) v1(187.36,44.04) v1(188.25,44.8) v1(189.13,45.56) v1(190.02,46.32) v1(190.79,47.09) v1(191.55,47.85) v1(191.93,5.68) v1(192.88,5.68) v1(193.83,5.68) v1(195.1,29.94) v1(198.78,23.34) v1(199.75,23.34) v1(200.06,79.72) v1(200.06,78.94) v1(200.06,78.08) v1(200.06,77.33) v1(200.06,76.51) v1(200.06,75.65) v1(200.69,23.34) v1(208.06,23.84) v1(209.07,23.84) v1(210.04,23.84) v1(211.02,23.84) v1(213.01,1.37) v1(213.9,1.37) v1(214.79,1.37) v1(215.64,1.37) v1(216.56,1.37) v1(217.47,1.37) v1(218.12,29.31) v1(219.02,29.31) v1(220,29.31) v1(223.3,7.21) v1(223.81,6.57) v1(232.57,27.15) v1(233.45,27.15) v1(234.27,27.15) v1(235.12,27.15) v1(237.72,1.37) v1(238.79,1.37) v1(239.81,1.37) v1(240.06,40.1) v1(240.06,39.05) v1(240.06,37.92) v1(240.06,36.65) v1(240.06,35.3) v1(240.06,34) v1(240.79,1.37) v1(241.84,1.37) v1(242.81,1.37) v1(243.24,47.21) v1(244.73,47.21) v1(244.76,28.04) v1(245.7,28.04) v1(246.46,47.21) v1(246.63,28.04) v1(247.57,28.04) v1(248.07,47.21) v1(248.19,6.45) v1(248.54,28.04) v1(249.02,6.45) v1(249.41,28.04) v1(249.79,47.21) v1(249.84,6.45) v1(251.62,47.21) v1(266.86,5.68) v1(267.6,5.68) v1(268.15,29.31) v1(268.37,5.68) v1(269.12,29.31) v1(270.03,29.31) v1(271.7,6.45) v1(272.53,6.45) v1(273.46,6.45) v1(283.37,27.02) v1(283.5,23.59) v1(284.29,27.02) v1(284.46,23.59) v1(285.19,27.02) v1(285.53,23.59) v1(286.65,23.59) v1(287.78,23.59) v1(288.84,23.59) v1(292.26,5.68) v1(293.08,5.68) v1(293.37,29.31) v1(293.9,5.68) v1(294.29,29.31) v1(295.18,29.31) v1(299.88,6.45) v1(300.77,6.45) v1(302.16,47.85) v1(303.05,48.74) v1(303.82,49.5) v1(304.7,50.26) v1(305.47,51.15) v1(306.36,52.04) v1(308.84,27.02) v1(309.64,27.02) v1(310.54,27.02) v1(317.15,5.68) v1(318.11,5.68) v1(319.06,5.68) v1(320.07,29.18) v1(323.84,6.57) v1(324.93,6.57) v1(325.91,6.57) v1(333.15,26.89) v1(334.14,26.89) v1(335.19,26.89) v1(336.13,26.89) v1(342.04,5.68) v1(342.98,5.68) v1(344,5.68) v1(348.79,6.57) v1(349.59,6.57) v1(350.42,6.57) v1(367.14,8.42) v1(367.14,7.48) v1(367.14,6.5) v1(380.65,52.16) v1(380.65,51.09) v1(380.65,50.13) v1(380.65,49.18) v1(380.65,48.06) v1(380.65,47.09) v1(380.65,24.73) v1(380.65,23.64) v1(380.65,22.45) v1(380.65,21.28) v1(380.65,19.97) v1(380.65,18.66) v1(384.08,60.04) v1(384.08,59.03) v1(384.08,57.87) v1(384.08,56.89) v1(384.08,55.81) v1(384.08,54.72) v1(385.48,77.18) v1(386.49,92.68) v1(386.49,87.47) v1(386.51,77.18) v1(387.35,92.68) v1(387.39,87.47) v1(387.57,77.18) v1(388.32,92.68) v1(388.36,87.47) v1(389.33,92.68) v1(389.37,87.47) v1(390.27,92.68) v1(390.31,87.47) v1(391.19,92.68) v1(391.19,87.47) v1(401,64.61) v1(401.73,4.54) v1(401.86,64.61) v1(403.13,4.54) v1(403.51,50.9) v1(403.51,50.06) v1(403.51,49.09) v1(404.46,4.54) v1(405.58,4.54) v1(406.76,4.54) v1(407.83,4.54) v1(414.11,83.41) v1(415.13,83.41) v1(416.08,83.41) v1(416.2,77.19) v1(417.04,83.41) v1(417.1,77.18) v1(418.05,83.41) v1(418.1,77.18) v1(419,83.41) v1(430.31,83.41) v1(431.31,83.41) v1(431.83,77.18) v1(432.43,83.41) v1(432.89,77.18) v1(433.23,83.41) v1(433.99,77.18) v1(434.23,83.41) v1(435.02,83.41) v1(446.82,83.41) v1(447.77,83.41) v1(448.73,83.41) v1(449.68,83.41) v1(450.53,83.41) v1(451.52,83.41) v1(462.94,83.41) v1(464.07,83.41) v1(464.97,83.41) v1(465.81,83.41) v1(466.82,83.41) v1(467.77,83.41)
COL1: length 337.9
  Top Layer w0.254: KEY6.2 KEY6.1
  Top Layer w0.42: KEY6.1 265.59,66.02 v1(265.56,66.05) ; v1(232.54,70.88) 218.16,85.26 COL_D.1 ; v1(215.52,60.34) 213.14,60.34 212.34,59.55 ; R34.2 211.06,59.42 203.33,51.69 170.56,51.69 v1(157.48,38.61)
  Bottom Layer w0.42: KEY24.1 105.28,36.29 110.83,30.73 ; 60.95,30.73 110.83,30.73 ; 60.95,30.73 35.43,30.73 30,36.16 KEY36.1 ; 60.95,30.73 55.4,36.29 KEY30.1 ; 110.83,30.73 136.02,30.73 ; v1(215.52,60.34) 218.16,62.98 COL_D.1 ; v1(265.56,66.05) 260.73,70.88 v1(232.54,70.88) ; 136.02,30.73 130.42,36.33 KEY18.1 ; 136.02,30.73 150.37,30.73 152.4,32.77 152.4,35.57 155.44,38.61 v1(157.48,38.61)
COL2: length 641.8
  Top Layer w0.254: KEY7.2 292.73,61.47 ; KEY2.2 KEY2.1
  Top Layer w0.42: v1(220.66,60.34) 219.74,59.42 R35.2 ; v1(204.96,22.27) 208.25,25.56 v1(208.25,30.21) ; COL_D.2 225.36,92.47 v1(230.76,92.47) ; v1(280.07,51.4) 262.67,34 v1(262.67,23.72) ; v1(188.12,28.92) 155.35,28.92 v1(146.59,20.16)
  Bottom Layer w0.42: KEY19.1 268.25,18.14 v1(262.67,23.72) ; v1(208.25,30.21) 208.25,35.97 205.64,38.58 205.64,45.32 v1(220.66,60.34) COL_D.2 215.71,92.72 39.37,92.72 26.04,79.39 26.04,65.51 KEY2.2 ; v1(280.07,51.4) 287.19,51.4 ; KEY2.1 6.13,58.1 6.13,27.9 KEY31.1 ; v1(204.96,22.27) 203.49,20.8 196.25,20.8 v1(188.12,28.92) ; 292.73,61.47 292.6,61.47 289.81,58.69 289.81,54.04 287.27,51.5 ; v1(230.76,92.47) 314.2,92.47 316.99,89.68 316.99,73.23 KEY7.2 ; KEY25.1 146.58,20.16 v1(146.59,20.16)
COL3: length 638.7
  Top Layer w0.254: KEY3.2 KEY3.1 ; KEY8.2 KEY8.1
  Top Layer w0.42: v1(223.14,60.34) 224.12,59.36 R36.2 ; v1(183.29,20.03) 223.17,20.03 232.89,29.75 v1(232.89,32.04) ; v1(168.56,10.19) 168.56,7.08 v1(166.38,4.9) ; v1(45.31,10.45) 45.31,8.03 v1(48.67,4.67)
  Bottom Layer w0.42: v1(168.56,10.19) 168.56,15.84 KEY26.1 171.48,20.03 v1(183.29,20.03) ; v1(166.38,4.9) 162.85,1.37 51.85,1.37 48.67,4.54 v1(48.67,4.67) ; v1(45.31,10.45) 42.7,13.06 KEY32.1 42.7,17.75 40.42,20.03 16.54,20.03 7.78,28.8 7.78,50.77 11.46,54.45 35.49,54.45 KEY3.2 ; v1(232.89,32.04) 232.89,36.48 KEY14.1 230.78,46.2 228.25,48.74 228.25,53.31 223.14,58.42 v1(223.14,60.34) 223.16,60.36 COL_D.3 229,93.61 318.39,93.61 332.96,79.04 KEY8.1 335.15,59.28 340.05,59.28 341.66,57.67 341.66,26.64 336.2,21.18 297.97,21.18 KEY20.1
COL4: length 525.1
  Top Layer w0.254: 63.02,61.47 KEY1.1 ; KEY9.2 KEY9.1
  Top Layer w0.42: v1(97,19.78) 98.96,19.78 105.19,26 v1(106.51,26) ; v1(227.97,60.34) 228.85,59.45 R37.2 ; v1(190.05,21.15) 190.05,26.67 194.47,31.08 211.99,31.08 217.07,36.16 217.07,41.75 217.37,42.05 230.5,42.05 233.05,44.59 v1(233.55,44.59) v1(237.24,44.59) ; KEY9.1 357.28,58.64 v1(311.05,58.64) ; v1(159.29,26) v1(176.74,26) ; v1(67.34,20.03) 65.18,22.19 v1(65.18,32.73) ; v1(147.11,26) v1(115.83,26)
  Bottom Layer w0.42: v1(67.34,20.03) 67.34,16.85 KEY33.1 67.72,18.26 69.24,19.78 v1(97,19.78) ; COL_D.4 225.66,62.64 v1(227.97,60.34) 229.36,58.94 229.36,48.78 v1(233.55,44.59) ; v1(176.74,26) 178.27,26 184.39,19.88 188.78,19.88 v1(190.05,21.15) 193.06,18.14 KEY27.1 ; v1(65.18,32.73) 65.18,59.31 63.02,61.47 ; KEY9.1 343.19,44.55 343.19,26.51 336.84,20.16 322.1,20.16 318.41,16.48 ; v1(159.29,26) v1(147.11,26) ; v1(237.24,44.59) 274.81,44.59 280.82,38.58 280.95,38.7 291.12,38.7 v1(311.05,58.64) ; v1(115.83,26) v1(106.51,26)
COL5: length 536
  Top Layer w0.254: KEY4.2 KEY4.1 ; KEY10.2 KEY10.1
  Top Layer w0.42: v1(228.16,64.53) 227.08,63.45 227.08,63.43 226.78,63.13 202.8,63.13 202.66,62.99 167.41,62.99 KEY10.2 ; KEY10.1 135.19,43.28 120.05,43.28 114.71,37.94 114.71,21.3 111.28,17.88 v1(96.3,17.88) ; v1(232.3,21.94) 236.51,21.94 238.66,24.1 v1(238.66,30.46) ; v1(230.63,62.62) 231.51,62.62 233.05,61.09 R38.2 ; v1(344.71,42.64) 311.56,42.64 v1(310.93,42.01) ; v1(233.55,45.86) v1(237.36,45.86) ; v1(296.7,45.86) 300.43,45.86 v1(300.51,45.94)
  Bottom Layer w0.42: KEY10.1 136.48,78.37 KEY4.2 ; KEY34.1 94.9,16.48 v1(96.3,17.88) ; v1(232.3,21.94) 226.35,21.94 220.88,16.48 KEY28.1 ; v1(300.51,45.94) 305.97,40.49 KEY16.1 307.5,38.58 v1(310.93,42.01) ; COL_D.5 v1(228.16,64.53) 228.73,64.53 v1(230.63,62.62) 230.63,48.78 v1(233.55,45.86) 238.66,40.75 v1(238.66,30.46) ; v1(237.36,45.86) v1(296.7,45.86) ; v1(344.71,42.64) 344.71,26.51 343.43,25.24 KEY22.1
COL6: length 577.5
  Top Layer w0.254: KEY11.2 KEY11.1 ; KEY5.2 KEY5.1
  Top Layer w0.42: v1(114.05,23.84) 114.05,55.63 110.39,59.28 105.5,59.28 KEY5.2 148.45,61.47 151.51,64.53 v1(176.91,64.53) ; 241.84,2.76 366.3,2.76 v1(369.6,6.06) ; 241.84,2.76 128.17,2.76 v1(120.94,10) ; 241.84,2.76 251.62,12.54 251.62,14.79 v1(251.6,14.81) ; v1(368.59,22.32) 354.36,36.54 v1(339.63,36.54) ; KEY11.2 227.57,61.47 v1(230.63,64.53) 233.54,64.53 237.11,60.96 R39.2
  Bottom Layer w0.42: KEY17.1 333.02,36.54 v1(339.63,36.54) ; v1(176.91,64.53) 179.97,61.47 KEY11.1 ; v1(230.63,64.53) 230.63,87.74 COL_D.6 ; v1(114.05,23.84) 117.88,20.01 KEY35.1 117.88,13.06 v1(120.94,10) ; v1(368.59,22.32) 368.59,16.61 KEY23.1 369.6,15.33 v1(369.6,6.06) ; v1(251.6,14.81) 249.93,16.48 KEY29.1
EDIT_KEY: length 25.3
  Top Layer w0.42: EDIT_F.4 300.61,84.6 304.29,84.6 308.32,88.62 EDIT_D.3
EDIT_S1: length 25.3
  Top Layer w0.42: EDIT_F.2 297.94,87.01 301.24,87.01 303.02,88.79 EDIT_D.1
EDIT_S2: length 25.3
  Top Layer w0.42: EDIT_D.2 302.77,85.74 299.47,85.74 287.15,73.42 EDIT_F.3
LED1: length 141.7
  Top Layer w0.42: LED_Control.1 159.38,88.15 153.29,82.06 153.29,69.48 156.97,65.8 v1(252.22,65.8) ; v1(261.87,67.83) 261.87,67.87 266.03,72.02 266.45,72.02 266.45,72.01 269.24,72.01
  Bottom Layer w0.42: v1(261.87,67.83) 259.84,65.8 v1(252.22,65.8)
LED2: length 169.7
  Top Layer w0.42: 299.21,72.01 294.14,66.94 v1(259.46,66.94) ; v1(252.22,67.07) 157.1,67.07 154.43,69.74 154.43,80.26 LED_Control.2
  Bottom Layer w0.42: v1(252.22,67.07) 252.35,66.94 v1(259.46,66.94)
LED3: length 18.7
  Top Layer w0.42: 163.45,69.98 163.45,86.77 LED_Control.3
LED4: length 28.9
  Top Layer w0.42: LED_Control.4 170.55,88.15 188.72,69.98
OT1: length 8.7
  Top Layer w0.42: U5.4 389.21,80.57 388.37,81.41 384.06,81.41 R26.1
OT2: length 9
  Top Layer w0.42: R27.1 412.05,80.19 413.64,81.79 417.15,81.79 U6.4
OT3: length 8.1
  Top Layer w0.42: R28.1 429.01,79.88 430.4,81.28 434.04,81.28 U7.4
OT4: length 8.8
  Top Layer w0.42: U8.4 450.3,81.41 446.66,81.41 445.14,79.88 R29.1
OT5: length 8.3
  Top Layer w0.42: U9.4 466.81,81.28 463.17,81.28 461.77,79.88 R30.1
RELEASE_KEY: length 25.4
  Top Layer w0.42: RELEASE_F.4 263.02,84.34 266.83,84.34 270.85,88.37 RELEASE_D.3
RELEASE_S1: length 25.2
  Top Layer w0.42: RELEASE_F.2 260.1,86.5 263.56,86.5 RELEASE_D.1
RELEASE_S2: length 25.2
  Top Layer w0.42: RELEASE_F.3 249.81,73.42 261.75,85.36 264.92,85.36 RELEASE_D.2
RGB_DATA: length 22.7
  Top Layer w0.42: 13.35,74.14 13.37,74.12 16.24,74.12 U13.2 19.34,74.14 20.48,75.28 v1(20.48,83.66)
  Bottom Layer w0.42: v1(20.48,83.66) 18.74,85.4 RGB_PWR.1
ROW1: length 274.2
  Top Layer w0.42: v1(215.9,31.38) 216.32,30.96 229.45,30.96 233.6,35.11 D13.1 240.96,31 v1(259.08,31) ; v1(265.43,31) 279.91,31 284.01,35.11 D15.1 287.23,35.11 291.38,30.96 305.26,30.96 309.42,35.11 D25.1 316.44,30.83 333.03,30.83 D27.1 ; v1(158.37,36.46) 159.72,35.11 D1.1 189.02,35.11 193.17,39.26 197.23,39.26 199.94,36.54 210.53,36.54 D3.1 213.23,33.84 v1(213.23,33.8)
  Bottom Layer w0.42: ROW_D.1 188.57,83.07 169.29,83.07 158.37,72.15 v1(158.37,36.46) ; v1(265.43,31) v1(259.08,31) ; v1(213.23,33.8) 215.65,31.38 v1(215.9,31.38)
ROW2: length 396.8
  Top Layer w0.42: D28.1 366.43,4.29 355.12,4.29 ; v1(187.2,34.19) v1(187.2,29.84) ; D2.1 138.18,36.51 v1(138.18,36.59) ; 354.77,4.33 354.81,4.29 355.12,4.29 ; 354.77,4.33 330.26,4.26 328.07,6.45 328.07,9.45 D16.1 324.69,12.84 320.93,12.84 320.04,13.73 314.32,13.73 311.91,16.14 307.34,16.14 303.95,12.76 D14.1 299.7,7.67 296.33,4.29 278.06,4.12 274.76,7.27 274.63,12.75 D4.1 274.63,12.95 276.26,14.57 276.26,16.99 272.7,20.54 v1(226.47,20.54) ; 354.77,4.33 354.93,4.48 ; 354.93,4.48 355.12,4.29 ; 354.93,4.48 349.84,9.57 D26.1 ; v1(151.51,67.07) v1(148.34,63.89) ; v1(222.41,16.35) 219.11,13.05 214.79,13.05 209.53,18.31 v1(204.08,18.31)
  Bottom Layer w0.42: v1(148.34,63.89) 138.18,53.73 v1(138.18,36.59) ; v1(151.51,67.07) 168.78,84.34 186.44,84.34 191.52,89.42 194.94,89.42 196.02,88.35 ROW_D.2 196.15,87.9 196.15,50.24 187.2,41.29 v1(187.2,34.19) ; v1(226.47,20.54) 226.47,20.42 v1(222.41,16.35) ; v1(187.2,29.84) 187.2,28.45 197.34,18.31 v1(204.08,18.31)
ROW3: length 284.9
  Top Layer w0.42: D7.1 149.23,12.68 149.23,9.92 142.96,3.65 ; D5.1 109.22,32.7 v1(109.22,22.75) ; v1(116.46,20.38) 116.5,20.42 126.41,20.42 127.41,19.41 127.41,8.1 131.86,3.65 142.96,3.65 ; D29.1 224.5,12.17 ; 224.5,12.17 224.5,7.84 228.05,4.29 241.23,4.29 249.57,12.63 D31.1 ; 224.5,12.17 216.62,4.29 202.22,4.29 199.43,7.07 D19.1 198.97,12.76 v1(196.47,15.25) ; 142.96,3.65 166.4,3.65 174.37,11.62 D17.1 176.69,14.95 176.69,19.02 178.59,20.92 186.14,20.92 v1(189.1,23.89) 189.1,34.25 v1(193.32,38.47)
  Bottom Layer w0.42: ROW_D.3 198.52,43.67 v1(193.32,38.47) ; v1(116.46,20.38) 111.59,20.38 v1(109.22,22.75) ; v1(189.1,23.89) 196.47,16.52 v1(196.47,15.25)
ROW4: length 447.4
  Top Layer w0.42: 52.48,2.25 32.29,2.25 24,10.54 D8.1 24.17,12.76 27.94,16.52 27.94,18.17 6.38,39.73 6.38,64.94 v1(12.34,70.9) ; 52.48,2.25 50.7,4.03 50.7,11.08 D18.1 ; 52.48,2.25 77.63,2.25 ; D6.1 61.6,16.02 64.01,13.6 73.25,13.6 D20.1 75.72,11.13 75.72,4.16 77.63,2.25 ; D32.1 122.55,12.76 112.05,2.25 101.63,2.25 ; v1(22.35,80.86) 31.37,89.88 31.37,89.93 v1(138.3,89.93) ; 101.63,2.25 77.63,2.25 ; 101.63,2.25 99.17,4.72 D30.1 ; ROW_D.4 198.99,90.06 v1(143,90.06)
  Bottom Layer w0.42: v1(143,90.06) 138.43,90.06 v1(138.3,89.93) ; v1(22.35,80.86) 12.39,70.9 v1(12.34,70.9)
ROW5: length 288.2
  Top Layer w0.42: D21.1 26.16,53.14 D11.1 ; 46.36,53 46.36,44.89 D9.1 ; 76.36,52.97 67.73,52.97 D23.1 ; 76.36,52.97 D35.1 110.63,52.45 v1(112.65,50.43) ; 76.36,52.97 59.55,69.78 D33.1 ; D23.1 46.36,53 ; D23.1 46.36,53.06 ; ROW_D.5 200.35,91.2 142.11,91.2 121.79,70.88 v1(121.67,70.88)
  Bottom Layer w0.42: v1(112.65,50.43) 113.16,49.92 118.36,49.92 121.67,53.23 v1(121.67,70.88)
ROW6: length 242.4
  Top Layer w0.42: ROW_D.6 206.02,71.23 v1(206.12,71.13) ; v1(203.07,52.85) 200.19,52.85 D36.1 D34.1 ; D24.1 352.3,52.76 D22.1 312.42,52.89 D12.1 285.12,52.76 D10.1 209.59,52.89 v1(209.55,52.85)
  Bottom Layer w0.42: v1(206.12,71.13) 206.12,55.89 v1(203.07,52.85) v1(209.55,52.85)
TIMBER_KEY: length 26.7
  Top Layer w0.42: TIM_D.3 347.81,88.49 344.3,84.98 339.22,84.98 TIM_F.4
TIMBER_S1: length 26.6
  Top Layer w0.42: TIM_D.1 342.14,88.79 340.87,87.52 336.68,87.52 TIM_F.2
TIMBER_S2: length 26.6
  Top Layer w0.42: TIM_F.3 325.5,73.42 338.2,86.12 342.65,86.12 TIM_D.2
$1N5525: length 16.6
  Top Layer w0.254: KEY2.3 KEY2.4
  Top Layer w0.42: KEY2.4 25.43,56.39 D11.2
$1N5566: length 16.4
  Top Layer w0.254: KEY3.3 KEY3.4
  Top Layer w0.42: KEY3.4 46.13,56.39 D21.2
$1N5571: length 17.1
  Top Layer w0.254: KEY1.3 63.02,56.39
  Top Layer w0.42: 63.02,56.39 67.34,56.39 D23.2
$1N5615: length 16.4
  Top Layer w0.254: KEY4.3 KEY4.4
  Top Layer w0.42: KEY4.4 46.31,73.29 D33.2
$1N5656: length 19.8
  Top Layer w0.254: KEY5.4 KEY5.3
  Top Layer w0.42: KEY5.4 110.58,56.39 D35.2
$1N5698: length 19.4
  Top Layer w0.254: KEY6.3 KEY6.4
  Top Layer w0.42: D10.2 284.96,56.39 KEY6.4
$1N5739: length 19.6
  Top Layer w0.254: 292.73,56.39 KEY7.4
  Top Layer w0.42: KEY7.4 312.13,56.39 D12.2
$1N5780: length 19.2
  Top Layer w0.254: KEY8.3 KEY8.4
  Top Layer w0.42: KEY8.4 345.49,56.36 D22.2
$1N5824: length 18.9
  Top Layer w0.254: KEY9.3 KEY9.4
  Top Layer w0.42: D24.2 378.81,56.39 KEY9.4
$1N5912: length 19.9
  Top Layer w0.254: KEY10.3 KEY10.4
  Top Layer w0.42: D34.2 173.2,56.39 KEY10.4
$1N5916: length 19.6
  Top Layer w0.254: KEY11.3 KEY11.4 200.12,56.39 D36.2
$1N7281: length 62.5
  Top Layer w0.42: R26.2 C1.1 384.1,75.26 389.38,69.98 v1(389.38,45.85) ; v1(401.7,41.15) 407.29,41.15 409.7,43.56 409.7,44.88 MCP3208.1
  Bottom Layer w0.42: v1(401.7,41.15) 391.03,41.15 389.38,42.8 v1(389.38,45.85)
$1N7500: length 34.4
  Top Layer w0.42: MCP3208.2 414.53,52.69 414.53,73.66 413.18,75.01 C2.1 412.05,75.07 R27.2
$1N7508: length 44.9
  Top Layer w0.42: v1(411.1,50.42) 409.72,50.42 MCP3208.3 ; R28.2 C3.1 427.05,75.01 425.7,73.66 425.7,52.71 423.42,50.42 v1(413.51,50.42)
  Bottom Layer w0.42: v1(413.51,50.42) v1(411.1,50.42)
$1N7516: length 58.3
  Top Layer w0.42: v1(426.72,52.71) 439.42,52.71 442.21,55.5 442.21,73.66 443.56,75.01 C4.1 445.14,75.14 R29.2 ; v1(412.88,52.71) 409.49,52.71 MCP3208.4
  Bottom Layer w0.42: v1(426.72,52.71) v1(412.88,52.71)
$1N7524: length 72.5
  Top Layer w0.42: MCP3208.5 409.49,55.25 v1(413.39,55.25) ; v1(443.74,55.25) 455.93,55.25 458.6,57.91 458.6,73.79 459.82,75.01 C5.1 R30.2
  Bottom Layer w0.42: v1(443.74,55.25) v1(413.39,55.25)
$1N8137: length 48.6
  Top Layer w0.42: MCP3208.13 401.27,52.45 v1(399.54,52.45) ; ADC_D.1 401.38,84.01 ADC_Z.1 401.19,74.55 390.78,64.14 390.78,57.53 v1(395.73,52.58)
  Bottom Layer w0.42: v1(399.54,52.45) 399.42,52.58 v1(395.73,52.58)
$1N8141: length 44.7
  Top Layer w0.42: v1(395.86,55.12) 393.45,57.53 393.45,63.88 403.73,74.17 ADC_Z.2 403.88,83.97 ADC_D.2 ; MCP3208.12 399.81,55.26 v1(399.67,55.12)
  Bottom Layer w0.42: v1(395.86,55.12) v1(399.67,55.12)
$1N8146: length 40.6
  Top Layer w0.42: MCP3208.11 401.53,57.79 v1(399.67,57.79) ; ADC_D.3 406.38,83.93 ADC_Z.3 406.27,74.17 395.99,63.88 395.99,58.17 v1(396.37,57.79)
  Bottom Layer w0.42: v1(396.37,57.79) v1(399.67,57.79)
$1N8151: length 35.3
  Top Layer w0.42: 399.42,62.46 399.33,62.46 R33.2 ; 399.42,62.46 399.42,64.64 408.81,74.04 ADC_Z.4 408.88,83.89 ADC_D.4 ; 399.42,62.46 MCP3208.10
$1N8999: length 71.1
  Top Layer w0.42: v1(356.62,70.49) 356.62,71.4 356.44,71.58 C7.1 352.35,71.58 351.54,72.39 351.54,73.77 R31.2
  Bottom Layer w0.42: MCP3208.6 409.47,57.79 405.89,57.79 404.5,59.18 404.5,63.63 401.45,66.68 360.43,66.68 v1(356.62,70.49)
$1N9093: length 14.1
  Top Layer w0.42: YG.2 364.83,71.51 358,71.51 355.33,74.19 R31.1
$1N13728: length 2.9
  Top Layer w0.42: LED3.2 269.27,70.54 269.24,70.51
$1N13732: length 3.6
  Top Layer w0.42: 299.21,70.51 302.73,70.51 LED4.2
$1N13737: length 3.8
  Top Layer w0.42: LED5.2 163.41,68.51 163.45,68.48
$1N13742: length 3.6
  Top Layer w0.42: LED6.2 188.69,68.51 188.72,68.48
$1N45682: length 22.4
  Top Layer w0.42: v1(150.53,36.29) 156.88,36.29 159.16,38.58 161.67,38.58 D1.2
  Bottom Layer w0.42: v1(150.53,36.29) 148.49,38.32 144.31,38.32 KEY12.2
$1N45750: length 22.8
  Top Layer w0.42: D3.2 209.55,40.99 v1(197.14,40.99)
  Bottom Layer w0.42: v1(197.14,40.99) 197.14,40.98 KEY13.2
$1N45791: length 22.3
  Top Layer w0.42: D13.2 234.82,40.61 v1(222.03,40.61)
  Bottom Layer w0.42: KEY14.2 221.91,40.61 v1(222.03,40.61)
$1N45832: length 22.4
  Top Layer w0.42: v1(272.07,40.61) 284.99,40.61 D15.2
  Bottom Layer w0.42: KEY15.2 271.94,40.61 v1(272.07,40.61)
$1N45873: length 22.5
  Top Layer w0.42: v1(297.21,40.74) 310.01,40.74 D25.2
  Bottom Layer w0.42: v1(297.21,40.74) 297.21,40.73 KEY16.2
$1N45914: length 22.6
  Top Layer w0.42: v1(322.36,40.74) 335.16,40.74 D27.2
  Bottom Layer w0.42: KEY17.2 322.24,40.74 v1(322.36,40.74)
$1N45955: length 23.8
  Top Layer w0.42: D2.2 134.46,40.89 v1(120.02,40.89)
  Bottom Layer w0.42: v1(120.02,40.89) 116.97,37.85 KEY18.2
$1N45996: length 22.8
  Top Layer w0.42: v1(259.75,18.64) 272.22,18.64 D4.2
  Bottom Layer w0.42: v1(259.75,18.64) 259.5,18.64 KEY19.2
$1N46037: length 22.9
  Top Layer w0.42: D14.2 297.16,18.76 v1(284.64,18.76)
  Bottom Layer w0.42: KEY20.2 284.64,18.76 v1(284.64,18.76)
$1N46078: length 22.8
  Top Layer w0.42: v1(309.78,18.64) 322.36,18.64 D16.2
  Bottom Layer w0.42: v1(309.78,18.64) 309.66,18.64 KEY21.2
$1N46158: length 22.7
  Top Layer w0.42: D26.2 347.55,18.51 v1(334.55,18.51)
  Bottom Layer w0.42: v1(334.55,18.51) 334.55,18.5 KEY22.2
$1N46199: length 22.8
  Top Layer w0.42: v1(359.82,18.64) 372.49,18.64 D28.2
  Bottom Layer w0.42: v1(359.82,18.64) 359.7,18.64 KEY23.2
$1N46240: length 24.1
  Top Layer w0.42: D5.2 109.19,41.02 v1(94.74,41.02)
  Bottom Layer w0.42: KEY24.2 91.83,38.11 v1(94.74,41.02)
$1N46281: length 22.9
  Top Layer w0.42: v1(134.4,18.76) 146.76,18.76 D7.2
  Bottom Layer w0.42: v1(134.4,18.76) 134.28,18.76 KEY25.2
$1N46322: length 22.7
  Top Layer w0.42: D17.2 172.08,18.51 v1(159.04,18.51)
  Bottom Layer w0.42: v1(159.04,18.51) 159.04,18.5 KEY26.2
$1N46363: length 22.7
  Top Layer w0.42: D19.2 197.15,18.51 v1(184.18,18.51)
  Bottom Layer w0.42: v1(184.18,18.51) 184.18,18.5 KEY27.2
$1N46404: length 22.7
  Top Layer w0.42: D29.2 222.22,18.51 v1(211.49,18.51)
  Bottom Layer w0.42: v1(211.49,18.51) 209.21,18.51 KEY28.2
$1N46458: length 22.8
  Top Layer w0.42: v1(234.35,18.51) 247.28,18.51 D31.2
  Bottom Layer w0.42: v1(234.35,18.51) 234.23,18.51 KEY29.2
$1N46499: length 22.5
  Top Layer w0.42: v1(46.64,40.74) 59.44,40.74 D6.2
  Bottom Layer w0.42: KEY30.2 46.64,40.73 v1(46.64,40.74)
$1N46540: length 23
  Top Layer w0.42: D8.2 21.47,18.76 v1(9.18,18.76)
  Bottom Layer w0.42: v1(9.18,18.76) 8.93,18.76 KEY31.2
$1N46581: length 22.7
  Top Layer w0.42: v1(33.94,18.64) 46.62,18.64 D18.2
  Bottom Layer w0.42: KEY32.2 33.94,18.63 v1(33.94,18.64)
$1N46622: length 22.9
  Top Layer w0.42: D20.2 71.56,18.76 v1(63.02,18.76)
  Bottom Layer w0.42: v1(63.02,18.76) 59.09,18.76 KEY33.2
